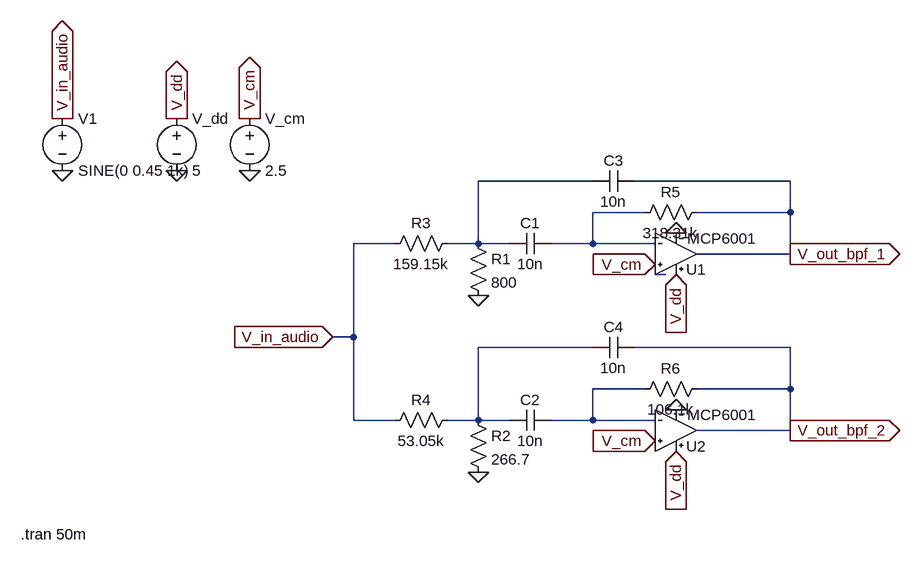
[diagram p0: schematic Exp6.asc]
Exp6.asc, the LTspice schematic file:
Version 4.1
SHEET 1 880 680
WIRE 80 -32 -96 -32
WIRE 384 -32 144 -32
WIRE 160 16 80 16
WIRE 384 16 384 -32
WIRE 384 16 240 16
WIRE -224 64 -288 64
WIRE -96 64 -96 -32
WIRE -96 64 -144 64
WIRE -48 64 -96 64
WIRE 80 64 80 16
WIRE 80 64 16 64
WIRE 176 64 80 64
WIRE 384 80 384 16
WIRE 384 80 240 80
WIRE 192 112 176 112
WIRE -288 208 -288 64
WIRE -288 208 -320 208
WIRE 80 224 -96 224
WIRE 384 224 144 224
WIRE 160 288 80 288
WIRE 384 288 384 224
WIRE 384 288 240 288
WIRE -288 336 -288 208
WIRE -224 336 -288 336
WIRE -96 336 -96 224
WIRE -96 336 -144 336
WIRE -48 336 -96 336
WIRE 80 336 80 288
WIRE 80 336 16 336
WIRE 176 336 80 336
WIRE 384 352 384 288
WIRE 384 352 240 352
FLAG 176 368 V_cm
IOPIN 176 368 In
FLAG 176 96 V_cm
IOPIN 176 96 In
FLAG 384 80 V_out_bpf_1
IOPIN 384 80 Out
FLAG 384 352 V_out_bpf_2
IOPIN 384 352 Out
FLAG -96 144 0
FLAG -96 416 0
FLAG 208 48 0
FLAG 208 320 0
FLAG -320 208 V_in_audio
IOPIN -320 208 In
FLAG -560 -48 0
FLAG -448 -48 0
FLAG -448 -128 V_cm
IOPIN -448 -128 Out
FLAG -560 -128 V_dd
IOPIN -560 -128 Out
FLAG 208 112 V_dd
IOPIN 208 112 In
FLAG 208 384 V_dd
IOPIN 208 384 In
FLAG -736 -48 0
FLAG -736 -128 V_in_audio
IOPIN -736 -128 Out
SYMBOL MCP6001 208 80 M180
SYMATTR InstName U1
SYMBOL MCP6001 208 352 M180
SYMATTR InstName U2
SYMBOL res -112 48 R0
SYMATTR InstName R1
SYMATTR Value 800
SYMBOL res -112 320 R0
SYMATTR InstName R2
SYMATTR Value 266.7
SYMBOL cap 16 48 R90
WINDOW 0 0 32 VBottom 2
WINDOW 3 32 32 VTop 2
SYMATTR InstName C1
SYMATTR Value 10n
SYMBOL cap 16 320 R90
WINDOW 0 0 32 VBottom 2
WINDOW 3 32 32 VTop 2
SYMATTR InstName C2
SYMATTR Value 10n
SYMBOL res -128 48 R90
WINDOW 0 0 56 VBottom 2
WINDOW 3 32 56 VTop 2
SYMATTR InstName R3
SYMATTR Value 159.15k
SYMBOL res -128 320 R90
WINDOW 0 0 56 VBottom 2
WINDOW 3 32 56 VTop 2
SYMATTR InstName R4
SYMATTR Value 53.05k
SYMBOL cap 144 -48 R90
WINDOW 0 0 32 VBottom 2
WINDOW 3 32 32 VTop 2
SYMATTR InstName C3
SYMATTR Value 10n
SYMBOL cap 144 208 R90
WINDOW 0 0 32 VBottom 2
WINDOW 3 32 32 VTop 2
SYMATTR InstName C4
SYMATTR Value 10n
SYMBOL res 256 0 R90
WINDOW 0 0 56 VBottom 2
WINDOW 3 32 56 VTop 2
SYMATTR InstName R5
SYMATTR Value 318.31k
SYMBOL res 256 272 R90
WINDOW 0 0 56 VBottom 2
WINDOW 3 32 56 VTop 2
SYMATTR InstName R6
SYMATTR Value 106.1k
SYMBOL voltage -560 -144 R0
SYMATTR InstName V_dd
SYMATTR Value 5
SYMBOL voltage -448 -144 R0
SYMATTR InstName V_cm
SYMATTR Value 2.5
SYMBOL voltage -736 -144 R0
WINDOW 123 0 0 Left 0
WINDOW 39 0 0 Left 0
SYMATTR InstName V1
SYMATTR Value SINE(0 0.45 1k)
TEXT -800 512 Left 2 !.tran 50m

The netlist it stands for:
* Exp6.asc
X§U1 V_cm N002 V_dd 0 V_out_bpf_1 MCP6001
X§U2 V_cm N005 V_dd 0 V_out_bpf_2 MCP6001
R1 N001 0 800
R2 N004 0 266.7
C1 N002 N001 10n
C2 N005 N004 10n
R3 N001 V_in_audio 159.15k
R4 N004 V_in_audio 53.05k
C3 V_out_bpf_1 N001 10n
C4 V_out_bpf_2 N004 10n
R5 V_out_bpf_1 N002 318.31k
R6 V_out_bpf_2 N005 106.1k
V_dd V_dd 0 5
V_cm V_cm 0 2.5
V1 V_in_audio 0 SINE(0 0.45 1k)
.tran 50m
.lib ./MCP6001.lib
.backanno
.end